# Altium schematic sheet Komunikacja.SchDoc: Low speed communications
size A3; SheetNumber: 7; SheetTotal: 17
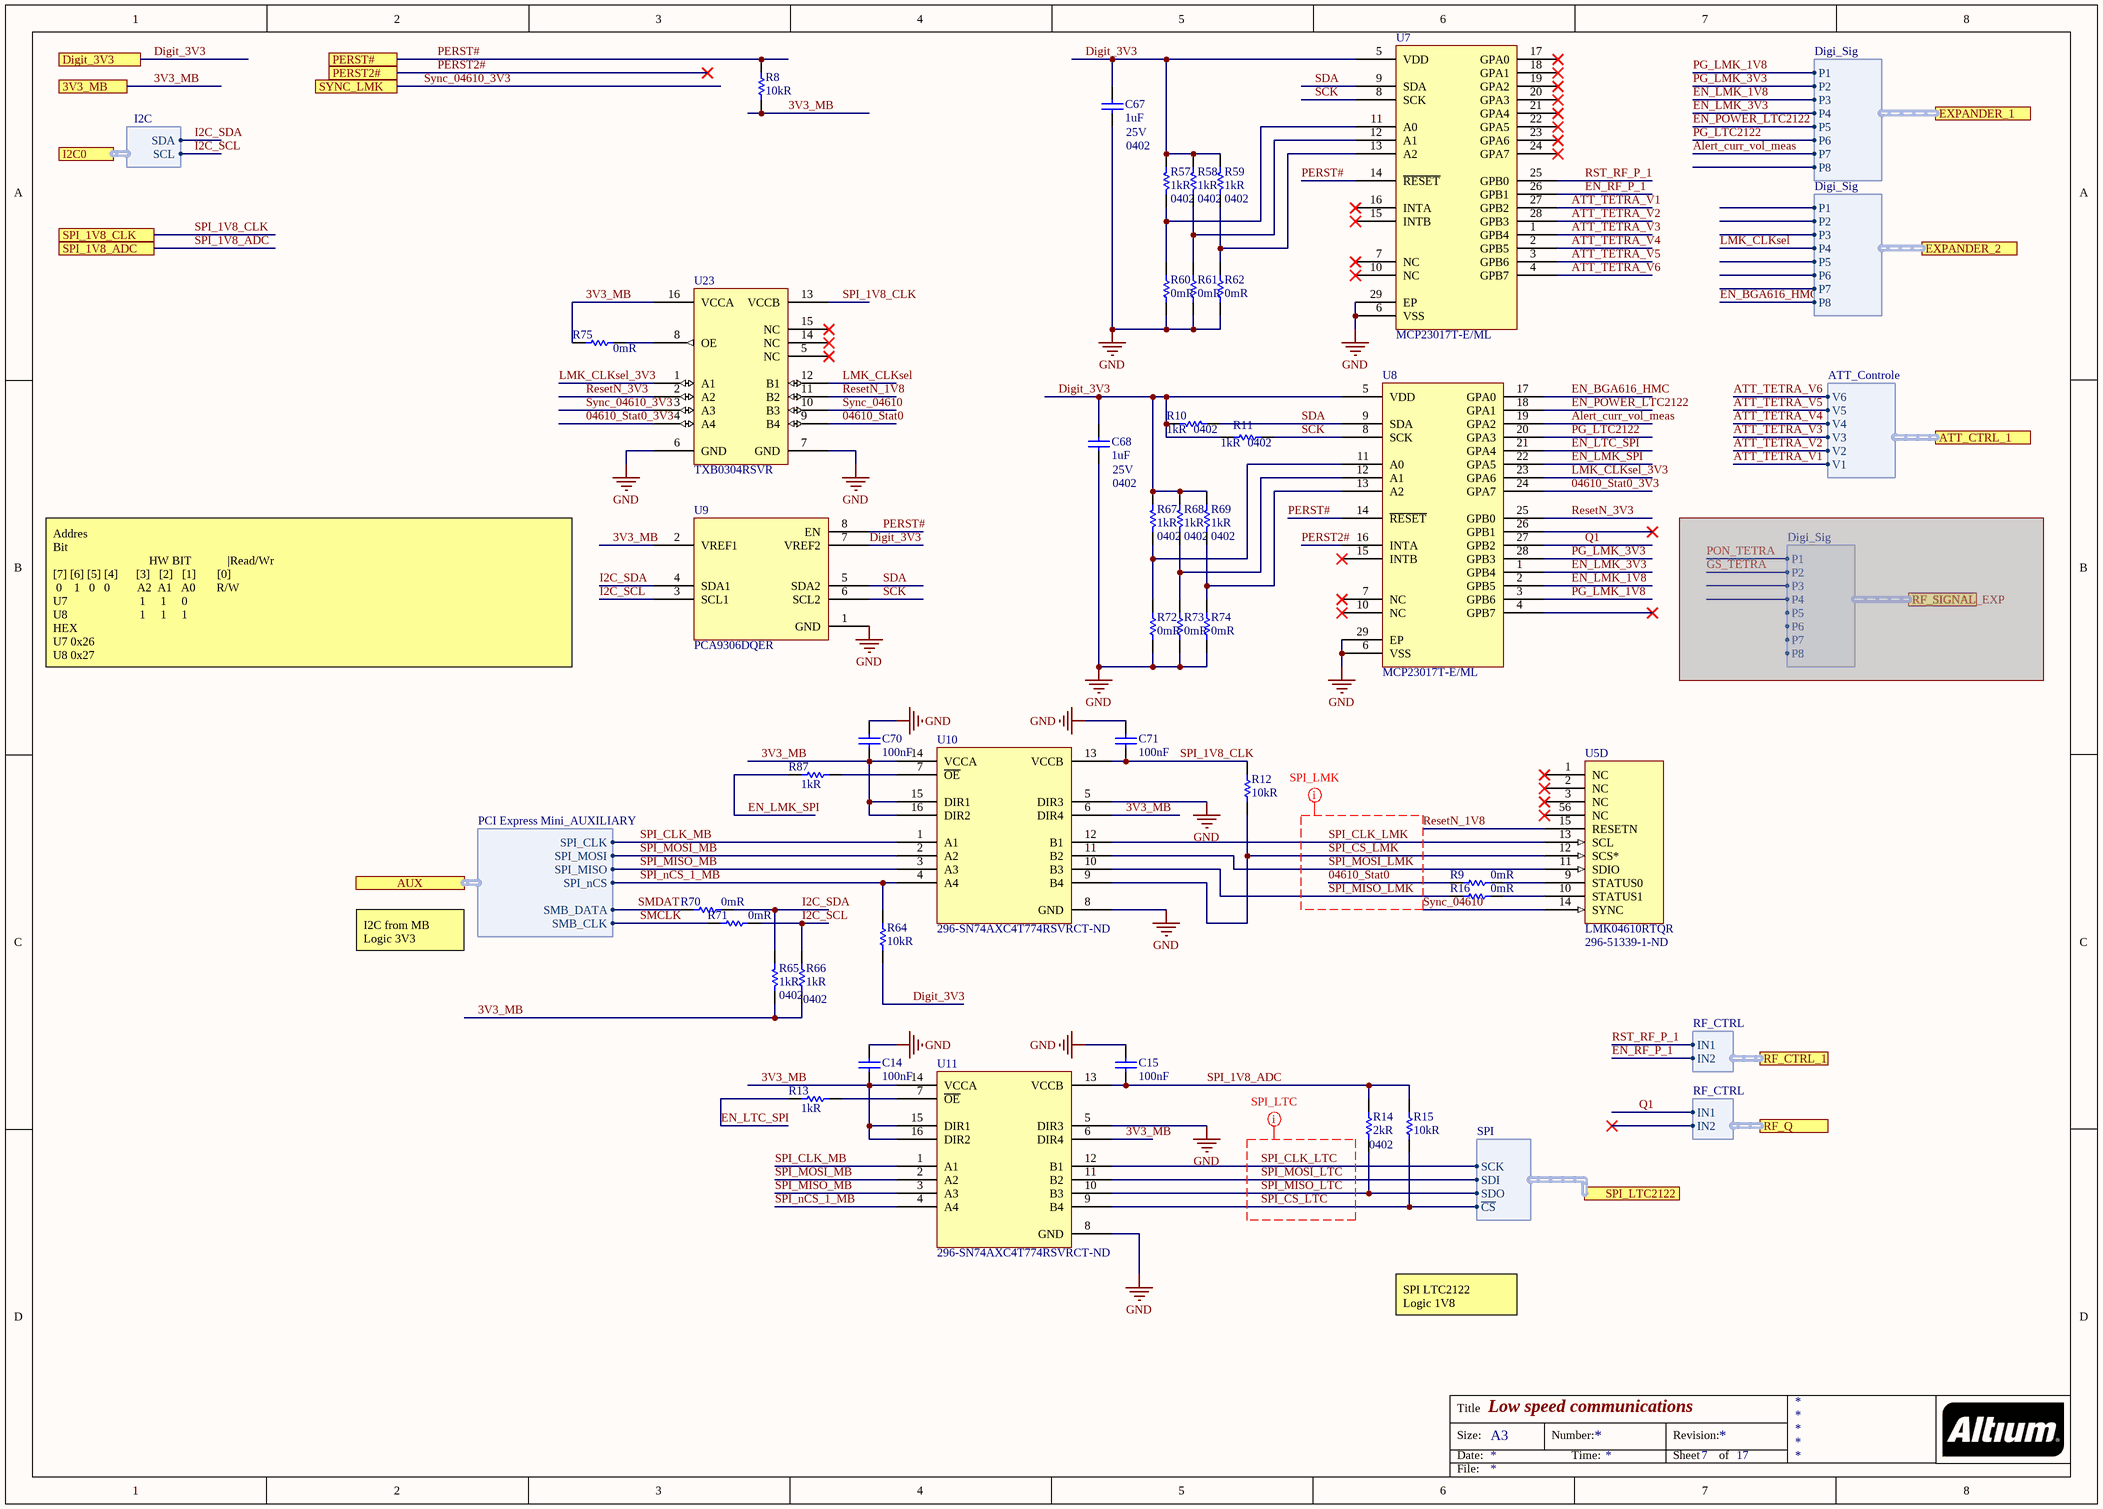
[diagram p0: Komunikacja.SchDoc]

## Parts
C14  100nF  [CAP 0201/0603 KK]
C15  100nF  [CAP 0201/0603 KK]
C67  1uF  Case/Package: 0402  Voltage Rating: 25V  [CAP 0402/1005 RF KK]
C68  1uF  Case/Package: 0402  Voltage Rating: 25V  [CAP 0402/1005 RF KK]
C70  100nF  [CAP 0201/0603 KK]
C71  100nF  [CAP 0201/0603 KK]
R8  10kR  [RES 0402/1005 RF KK]
R9  0mR  [RES 0402/1005 RF KK]
R10  1kR  Case/Package: 0402  [RES 0402/1005 RF KK]
R11  1kR  Case/Package: 0402  [RES 0402/1005 RF KK]
R12  10kR  [RES 0402/1005 RF KK]
R13  1kR  [RES 0402/1005 RF KK]
R14  2kR  Case/Package: 0402  [RES 0402/1005 RF KK]
R15  10kR  [RES 0402/1005 RF KK]
R16  0mR  [RES 0402/1005 RF KK]
R57  1kR  Case/Package: 0402  [RES 0402/1005 RF KK]
R58  1kR  Case/Package: 0402  [RES 0402/1005 RF KK]
R59  1kR  Case/Package: 0402  [RES 0402/1005 RF KK]
R60  0mR  [RES 0402/1005 RF KK]
R61  0mR  [RES 0402/1005 RF KK]
R62  0mR  [RES 0402/1005 RF KK]
R64  10kR  [RES 0402/1005 RF KK]
R65  1kR  Case/Package: 0402  [RES 0402/1005 RF KK]
R66  1kR  Case/Package: 0402  [RES 0402/1005 RF KK]
R67  1kR  Case/Package: 0402  [RES 0402/1005 RF KK]
R68  1kR  Case/Package: 0402  [RES 0402/1005 RF KK]
R69  1kR  Case/Package: 0402  [RES 0402/1005 RF KK]
R70  0mR  [RES 0402/1005 RF KK]
R71  0mR  [RES 0402/1005 RF KK]
R72  0mR  [RES 0402/1005 RF KK]
R73  0mR  [RES 0402/1005 RF KK]
R74  0mR  [RES 0402/1005 RF KK]
R75  0mR  [RES 0402/1005 RF KK]
R87  1kR  [RES 0402/1005 RF KK]
U5  LMK04610RTQR  Supplier Part Number 1: 296-51339-1-ND  [LMK04610]  (part D of 4)
U7  MCP23017T-E/ML  [MCP23017/MCP23S17]
U8  MCP23017T-E/ML  [MCP23017/MCP23S17]
U9  PCA9306DQER  [PCA9306]
U10  Supplier Part Number 1: 296-SN74AXC4T774RSVRCT-ND  [16-UGFN]  (hidden comment: SN74AXC4T774RSVR)
U11  Supplier Part Number 1: 296-SN74AXC4T774RSVRCT-ND  [16-UGFN]  (hidden comment: SN74AXC4T774RSVR)
U23  TXB0304RSVR  [TXB0304]

## Ports
3V3_MB, ATT_CTRL_1 (harness ATT_Controle), AUX (harness PCI Express Mini_AUXILIARY), Digit_3V3, EXPANDER_1 (harness Digi_Sig), EXPANDER_2 (harness Digi_Sig), I2C0 (harness I2C), PERST2#, PERST#, RF_CTRL_1 (harness RF_CTRL), RF_Q (harness RF_CTRL), RF_SIGNAL_EXP (harness Digi_Sig), SPI_1V8_ADC, SPI_1V8_CLK, SPI_LTC2122 (harness SPI), SYNC_LMK

## Harnesses
PCI Express Mini_AUXILIARY: SMB_DATA, SMB_CLK, SPI_nCS, SPI_MISO, SPI_MOSI, SPI_CLK
I2C: SDA, SCL
Digi_Sig: P1, P2, P3, P4, P5, P6, P7, P8
ATT_Controle: V1, V2, V3, V4, V5, V6
SPI: SCK, ~{CS}, SDO, SDI
RF_CTRL: IN1, IN2

## Nets
GND: C14.2 C15.2 C67.1 C68.1 C70.2 C71.2 R60.1 R61.1 R62.1 R72.1 R73.1 R74.1 U7.6(VSS) U7.29(EP) U8.6(VSS) U8.29(EP) U9.1(GND) U10.5(DIR3) U10.8(GND) U11.5(DIR3) U11.8(GND) U23.6(GND) U23.7(GND)
3V3_MB: C14.1 C70.1 R8.1 R65.2 R66.2 R75.1 U9.2(VREF1) U10.6(DIR4) U10.14(VCCA) U10.15(DIR1) U10.16(DIR2) U11.6(DIR4) U11.14(VCCA) U11.15(DIR1) U11.16(DIR2) U23.16(VCCA) ; port 3V3_MB
04610_Stat0: R9.2 U23.9(B4)
04610_Stat0_3V3: U8.24(GPA7) U23.4(A4)
Alert_curr_vol_meas: U8.19(GPA2) ; port EXPANDER_1.P7
ATT_TETRA_V1: U7.27(GPB2) ; port ATT_CTRL_1.V1
ATT_TETRA_V2: U7.28(GPB3) ; port ATT_CTRL_1.V2
ATT_TETRA_V3: U7.1(GPB4) ; port ATT_CTRL_1.V3
ATT_TETRA_V4: U7.2(GPB5) ; port ATT_CTRL_1.V4
ATT_TETRA_V5: U7.3(GPB6) ; port ATT_CTRL_1.V5
ATT_TETRA_V6: U7.4(GPB7) ; port ATT_CTRL_1.V6
Digit_3V3: C67.2 C68.2 R10.1 R11.1 R57.1 R58.1 R59.1 R64.1 R67.1 R68.1 R69.1 U7.5(VDD) U8.5(VDD) U9.7(VREF2) ; port Digit_3V3
EN_BGA616_HMC: U8.17(GPA0) ; port EXPANDER_2.P8
EN_LMK_1V8: U8.2(GPB5) ; port EXPANDER_1.P3
EN_LMK_3V3: U8.1(GPB4) ; port EXPANDER_1.P4
EN_LMK_SPI: R87.2 U8.22(GPA5)
EN_LTC_SPI: R13.2 U8.21(GPA4)
EN_POWER_LTC2122: U8.18(GPA1) ; port EXPANDER_1.P5
EN_RF_P_1: U7.26(GPB1) ; port RF_CTRL_1.IN2
I2C_SCL: R66.1 R71.2 U9.3(SCL1) ; port I2C0.SCL
I2C_SDA: R65.1 R70.2 U9.4(SDA1) ; port I2C0.SDA
LMK_CLKsel: U23.12(B1) ; port EXPANDER_2.P4
LMK_CLKsel_3V3: U8.23(GPA6) U23.1(A1)
PERST2#: U8.16(INTA) ; port PERST2#
PERST#: R8.2 U7.14(~{RESET}) U8.14(~{RESET}) U9.8(EN) ; port PERST#
PG_LMK_1V8: U8.3(GPB6) ; port EXPANDER_1.P1
PG_LMK_3V3: U8.28(GPB3) ; port EXPANDER_1.P2
PG_LTC2122: U8.20(GPA3) ; port EXPANDER_1.P6
Q1: U8.27(GPB2) ; port RF_Q.IN1
ResetN_1V8: U5.15(RESETN) U23.11(B2)
ResetN_3V3: U8.25(GPB0) U23.2(A2)
RST_RF_P_1: U7.25(GPB0) ; port RF_CTRL_1.IN1
SCK: R11.2 U7.8(SCK) U8.8(SCK) U9.6(SCL2)
SDA: R10.2 U7.9(SDA) U8.9(SDA) U9.5(SDA2)
SMCLK: R71.1 ; port AUX.SMB_CLK
SMDAT: R70.1 ; port AUX.SMB_DATA
SPI_1V8_ADC: C15.1 R14.2 R15.2 U11.13(VCCB) ; port SPI_1V8_ADC
SPI_1V8_CLK: C71.1 R12.2 U10.13(VCCB) U23.13(VCCB) ; port SPI_1V8_CLK
SPI_CLK_LMK: U5.13(SCL) U10.12(B1)
SPI_CLK_LTC: U11.12(B1) ; port SPI_LTC2122.SCK
SPI_CLK_MB: U10.1(A1) U11.1(A1) ; port AUX.SPI_CLK
SPI_CS_LMK: R12.1 U5.12(SCS*) U10.9(B4)
SPI_CS_LTC: R15.1 U11.9(B4) ; port SPI_LTC2122.~{CS}
SPI_MISO_LMK: R16.2 U10.10(B3)
SPI_MISO_LTC: R14.1 U11.10(B3) ; port SPI_LTC2122.SDO
SPI_MISO_MB: U10.3(A3) U11.3(A3) ; port AUX.SPI_MISO
SPI_MOSI_LMK: U5.11(SDIO) U10.11(B2)
SPI_MOSI_LTC: U11.11(B2) ; port SPI_LTC2122.SDI
SPI_MOSI_MB: U10.2(A2) U11.2(A2) ; port AUX.SPI_MOSI
SPI_nCS_1_MB: R64.2 U10.4(A4) U11.4(A4) ; port AUX.SPI_nCS
Sync_04610: U5.14(SYNC) U23.10(B3)
Sync_04610_3V3: U23.3(A3) ; port SYNC_LMK
NetR9_1: R9.1 U5.9(STATUS0)
NetR13_1: R13.1 U11.7(~{OE})
NetR16_1: R16.1 U5.10(STATUS1)
NetR57_2: R57.2 R60.2 U7.11(A0)
NetR58_2: R58.2 R61.2 U7.12(A1)
NetR59_2: R59.2 R62.2 U7.13(A2)
NetR67_2: R67.2 R72.2 U8.11(A0)
NetR68_2: R68.2 R73.2 U8.12(A1)
NetR69_2: R69.2 R74.2 U8.13(A2)
NetR75_2: R75.2 U23.8(OE)
NetR87_1: R87.1 U10.7(~{OE})

Not connected (* = marked no-connect by the designer): U5 1(NC)* 2(NC)* 3(NC)* 56(NC)*; U7 7(NC)* 10(NC)* 15(INTB)* 16(INTA)* 17(GPA0)* 18(GPA1)* 19(GPA2)* 20(GPA3)* 21(GPA4)* 22(GPA5)* 23(GPA6)* 24(GPA7)*; U8 4(GPB7)* 7(NC)* 10(NC)* 15(INTB)* 26(GPB1)*; U23 5(NC)* 14(NC)* 15(NC)*

## Layout directives
net class SPI_LMK: 04610_Stat0, ResetN_1V8, SPI_CLK_LMK, SPI_CS_LMK, SPI_MISO_LMK, SPI_MOSI_LMK, Sync_04610
net class SPI_LTC: SPI_CLK_LTC, SPI_CS_LTC, SPI_MISO_LTC, SPI_MOSI_LTC

## Notes on the sheet
- Addres
  Bit
  HW BIT            |Read/Wr
  [7] [6] [5] [4]      [3]   [2]   [1]       [0]
  0    1   0   0         A2  A1   A0       R/W
  U7                        1     1     0
  U8                        1     1     1
  HEX
  U7 0x26
  U8 0x27
- I2C from MB
  Logic 3V3
- SPI LTC2122
  Logic 1V8
- Title
- Size:
- Date:
- A3
- Number:
- Time:
- Revision:
- Sheet
- of
- File:

## Library data of the parts
C14 C15 C70 C71 = Capacitor: Manufacturer 1: Murata; Manufacturer Part Number 1: GRM033R61C104ME84D; Voltage Rating: 16V; Tolerance: 20%; Dielectric: X5R; Supplier 1: Digi-Key; Supplier Part Number 1: 490-9986-1-ND; Stock 1: 503570; Pricing 1: 1=0.10000, 10=0.05400, 100=0.02430, 500=0.01732, 1000=0.01361, 2500=0.01238, 5000=0.01139 (USD); RoHS: Yes; Mount: Surface Mount; Case/Package: 0201; Weight: 1.2E-05oz; Case Code (Metric): 0603; Case Code (Imperial): 0201; Min Operating Temperature: -55°C; Max Operating Temperature: 85°C; Capacitance: 100nF; Packaging: Tape and Reel; Termination: SMD/SMT; Voltage Rating (DC): 16V; Package Quantity: 15000; Length: 0.024inch; Height: 0.3mm; Width: 0.3mm; Thickness: 0.013inch; ComponentLink1URL: http://www.mouser.com/ds/2/281/c02e-2905.pdf?src-supplier=Mouser; ComponentLink1Description: http://www.mouser.com/ds/2/281/c02e-2905.pdf?src-supplier=Mouser; ComponentLink2URL: http://search.murata.co.jp/Ceramy/image/img/A01X/G101/ENG/GRM033R61C104ME84-01.pdf?src-supplier=Digi-Key; ComponentLink2Description: http://search.murata.co.jp/Ceramy/image/img/A01X/G101/ENG/GRM033R61C104ME84-01.pdf?src-supplier=Digi-Key
C67 C68 = Capacitor: MURATA - GRT155R61E105KE01D - SMD Multilayer Ceramic Capacitor, 1 µF, 25 V, 0402 [1005 Metric], ± 10%, X5R, GRT Series - SMD Multilayer Ceramic Capacitor, 1 µF, 25 V, 0402 [1005 Metric], ± 10%, X5R, GRT Series; Supplier 1: Digi-Key; Supplier Part Number 1: 490-12263-1-ND; Manufacturer: Murata; Manufacturer Part Number: GRT155R61E105KE01D; RoHS: Yes; Category: Ceramic Capacitors; Stock 1: 341453; Pricing 1: 1=0,18000, 10=0,12300, 100=0,06210, 500=0,04248, 1000=0,03758, 2500=0,03594, 5000=0,03268 (USD); Mount: Surface Mount; Case Code (Metric): 1005; Case Code (Imperial): 0402; Min Operating Temperature: -55°C; Max Operating Temperature: 85°C; Packaging: Tape and Reel; Capacitance: 1uF; Tolerance: 10%; Dielectric: X5R; Voltage Rating (DC): 25V; Length: 0.039inch; Width: 0.02inch; Thickness: 0.022inch; Ratings: AEC-Q200; ComponentLink1URL: http://www.farnell.com/datasheets/2165918.pdf?src-supplier=Farnell; ComponentLink1Description: http://www.farnell.com/datasheets/2165918.pdf?src-supplier=Farnell; ComponentLink2URL: http://search.murata.co.jp/Ceramy/image/img/A01X/G101/ENG/GRT155R61E105KE01-01.pdf?src-supplier=Digi-Key; ComponentLink2Description: http://search.murata.co.jp/Ceramy/image/img/A01X/G101/ENG/GRT155R61E105KE01-01.pdf?src-supplier=Digi-Key; ComponentLink3URL: http://www.farnell.com/datasheets/2165918.pdf?src-supplier=Element14; ComponentLink3Description: http://www.farnell.com/datasheets/2165918.pdf?src-supplier=Element14
R8 R12 R15 R64 = Resistor: Manufacturer 1: Vishay; Manufacturer Part Number 1: CRCW0402-10K0FKED; Tolerance: 1%; Power Rating: 63mW; Voltage Rating: 50V; Temperature Coefficient: 100ppm/°C; Supplier 1: Newark; Supplier Part Number 1: 52K6595; Stock 1: 0; RoHS: Yes; Mount: Surface Mount; Case/Package: 0402; Number of Pins: 2; Weight: 2.3E-05oz; Case Code (Metric): 1005; Case Code (Imperial): 0402; Contact Plating: Tin; Min Operating Temperature: -55°C; Max Operating Temperature: 155°C; Resistance: 10kR; Package Quantity: 10; Packaging: Tape and Reel; Termination: SMD/SMT; Military Standard: Not; Composition: Thick Film; Voltage Rating (DC): 50V; Number of Terminations: 2; Max Power Dissipation: 63mW; Features: Automotive AEC-Q200; Length: 1mm; Height: 0.35mm; Depth: 0.5mm; Width: 0.02inch; Radiation Hardening: No; REACH SVHC: Unknown; Lead Free: Lead Free; ComponentLink1URL: https://datasheet.ciiva.com/11809/0900766b80d98824-11809984.pdf?src-supplier=RSComponents; ComponentLink1Description: https://datasheet.ciiva.com/11809/0900766b80d98824-11809984.pdf?src-supplier=RSComponents; ComponentLink2URL: https://datasheet.ciiva.com/2463/dcrcwe3-2463025.pdf?src-supplier=Digi-Key; ComponentLink2Description: https://datasheet.ciiva.com/2463/dcrcwe3-2463025.pdf?src-supplier=Digi-Key; ComponentLink3URL: https://datasheet.ciiva.com/2463/dcrcwe3-2463026.pdf?src-supplier=Digi-Key; ComponentLink3Description: https://datasheet.ciiva.com/2463/dcrcwe3-2463026.pdf?src-supplier=Digi-Key; ComponentLink4URL: https://datasheet.ciiva.com/2463/dcrcwe3-2463027.pdf?src-supplier=Digi-Key; ComponentLink4Description: https://datasheet.ciiva.com/2463/dcrcwe3-2463027.pdf?src-supplier=Digi-Key; ComponentLink5URL: https://datasheet.ciiva.com/46385/1697337-46385560.pdf?src-supplier=Element14; ComponentLink5Description: https://datasheet.ciiva.com/46385/1697337-46385560.pdf?src-supplier=Element14; ComponentLink6URL: https://datasheet.ciiva.com/3255/dcrcwe3-3255961.pdf?src-supplier=Avnet; ComponentLink6Description: https://datasheet.ciiva.com/3255/dcrcwe3-3255961.pdf?src-supplier=Avnet; ComponentLink7URL: https://datasheet.ciiva.com/3255/dcrcwe3-3255962.pdf?src-supplier=Avnet; ComponentLink7Description: https://datasheet.ciiva.com/3255/dcrcwe3-3255962.pdf?src-supplier=Avnet; ComponentLink8URL: https://datasheet.ciiva.com/5547/dcrcwe3-109170-5547786.pdf?src-supplier=Mouser; ComponentLink8Description: https://datasheet.ciiva.com/5547/dcrcwe3-109170-5547786.pdf?src-supplier=Mouser; ComponentLink9URL: https://datasheet.ciiva.com/26316/fld-crcw-e3-data-en-26316618.pdf?src-supplier=Distrelec; ComponentLink9Description: https://datasheet.ciiva.com/26316/fld-crcw-e3-data-en-26316618.pdf?src-supplier=Distrelec; ComponentLink10URL: https://datasheet.ciiva.com/16208/dcrcwe3-16208525.pdf?src-supplier=Future+Electronics; ComponentLink10Description: https://datasheet.ciiva.com/16208/dcrcwe3-16208525.pdf?src-supplier=Future+Electronics; ComponentLink11URL: https://datasheet.ciiva.com/36856/1720486-36856909.pdf?src-supplier=Element14; ComponentLink11Description: https://datasheet.ciiva.com/36856/1720486-36856909.pdf?src-supplier=Element14
R9 R16 R60 R70 R71 R75 = Resistor: YAGEO - RC0402JR-070RL. - RES, THICK FILM, 0R, 0.0625W, 0402; Power Rating: 62.5mW; Tolerance: 5%; Voltage Rating: 50V; Max Power Dissipation: 63mW; Temperature Coefficient: 200ppm/°C; Supplier 1: Digi-Key; Supplier Part Number 1: 311-0.0JRCT-ND; Manufacturer: Yageo; Manufacturer Part Number: RC0402JR-070RL; RoHS: Yes; Category: Chip SMD Resistors; Stock 1: 45338179; Pricing 1: 1=0,10000, 10=0,01200, 25=0,00920, 50=0,00680, 100=0,00510, 250=0,00388, 500=0,00310, 1000=0,00228, 5000=0,00163 (USD); Case/Package: 0402; Case Code (Metric): 1005; Case Code (Imperial): 0402; Contact Plating: Tin,Matte; Min Operating Temperature: -55°C; Max Operating Temperature: 155°C; Package Quantity: 1; Resistance: 0mR; Packaging: Tape and Reel; Resistor Type: Thick Film; Number of Terminations: 2; Termination: SMD/SMT; Features: Moisture Resistant; Length: 1mm; Height: 0.016inch; Width: 0.02inch; Depth: 0.5mm; Radiation Hardening: No; REACH SVHC: Unknown; Military Standard: Not; Lead Free: Lead Free; ComponentLink1URL: https://datasheet.ciiva.com/2452/pyu-rc0402-51-rohs-l-6-2452608.pdf?src-supplier=Digi-Key; ComponentLink1Description: https://datasheet.ciiva.com/2452/pyu-rc0402-51-rohs-l-6-2452608.pdf?src-supplier=Digi-Key; ComponentLink2URL: https://datasheet.ciiva.com/11808/0900766b80c66297-11808195.pdf?src-supplier=RSComponents; ComponentLink2Description: https://datasheet.ciiva.com/11808/0900766b80c66297-11808195.pdf?src-supplier=RSComponents; ComponentLink3URL: https://datasheet.ciiva.com/2452/pyu-r-int-thick-7-2452609.pdf?src-supplier=Digi-Key; ComponentLink3Description: https://datasheet.ciiva.com/2452/pyu-r-int-thick-7-2452609.pdf?src-supplier=Digi-Key; ComponentLink4URL: https://datasheet.ciiva.com/2452/pyu-r-int-thick-7-2452610.pdf?src-supplier=Digi-Key; ComponentLink4Description: https://datasheet.ciiva.com/2452/pyu-r-int-thick-7-2452610.pdf?src-supplier=Digi-Key; ComponentLink5URL: https://datasheet.ciiva.com/8896/pyu-rc0402-51-rohs-l-6-8896201.pdf?src-supplier=Avnet; ComponentLink5Description: https://datasheet.ciiva.com/8896/pyu-rc0402-51-rohs-l-6-8896201.pdf?src-supplier=Avnet; ComponentLink6URL: https://datasheet.ciiva.com/28386/pyu-rc0402-51-rohs-l-6-28386633.pdf?src-supplier=Avnet+Europe; ComponentLink6Description: https://datasheet.ciiva.com/28386/pyu-rc0402-51-rohs-l-6-28386633.pdf?src-supplier=Avnet+Europe; ComponentLink7URL: https://datasheet.ciiva.com/22747/1018594-22747515.pdf?src-supplier=Element14; ComponentLink7Description: https://datasheet.ciiva.com/22747/1018594-22747515.pdf?src-supplier=Element14; ComponentLink8URL: https://datasheet.ciiva.com/15189/getdatasheetpartid-326379-15189533.pdf?src-supplier=Verical; ComponentLink8Description: https://datasheet.ciiva.com/15189/getdatasheetpartid-326379-15189533.pdf?src-supplier=Verical
R10 R11 R13 R57-R59 R65-R69 R87 = Resistor: Manufacturer 1: Yageo; Manufacturer Part Number 1: RC0402FR-071KL; Tolerance: 1%; Temperature Coefficient: 100ppm/°C; Power Rating: 62.5mW; Voltage Rating: 50V; Supplier 1: Digi-Key; Supplier Part Number 1: 311-1.00KLRCT-ND; Stock 1: 57541929; Pricing 1: 1=0,10000, 10=0,01600, 100=0,00640, 1000=0,00289, 2500=0,00251, 5000=0,00207 (USD); RoHS: Yes; Number of Pins: 2; Case Code (Imperial): 0402; Case Code (Metric): 1005; Min Operating Temperature: -55°C; Max Operating Temperature: 155°C; Packaging: Tape and Reel; Resistance: 1kR; Composition: Thick Film; Voltage Rating (DC): 50V; Termination: SMD/SMT; Military Standard: Not; Length: 1mm; Height: 0.32mm; Width: 0.5mm; Depth: 0.5mm; REACH SVHC: Unknown; Lead Free: Lead Free; ComponentLink1URL: https://datasheet.ciiva.com/11819/0900766b80c66297-11819477.pdf?src-supplier=RSComponents; ComponentLink1Description: https://datasheet.ciiva.com/11819/0900766b80c66297-11819477.pdf?src-supplier=RSComponents; ComponentLink2URL: https://datasheet.ciiva.com/12666/pyu-rc0402-51-rohs-l-6-r-12666741.pdf?src-supplier=Mouser; ComponentLink2Description: https://datasheet.ciiva.com/12666/pyu-rc0402-51-rohs-l-6-r-12666741.pdf?src-supplier=Mouser; ComponentLink3URL: https://datasheet.ciiva.com/17063/pyu-rc0402-51-rohs-l-6-r-17063193.pdf?src-supplier=Future+Electronics; ComponentLink3Description: https://datasheet.ciiva.com/17063/pyu-rc0402-51-rohs-l-6-r-17063193.pdf?src-supplier=Future+Electronics; ComponentLink4URL: https://datasheet.ciiva.com/22747/1018594-22747513.pdf?src-supplier=Element14; ComponentLink4Description: https://datasheet.ciiva.com/22747/1018594-22747513.pdf?src-supplier=Element14; ComponentLink5URL: https://datasheet.ciiva.com/7849/1018594-7849869.pdf?src-supplier=Element14; ComponentLink5Description: https://datasheet.ciiva.com/7849/1018594-7849869.pdf?src-supplier=Element14; ComponentLink6URL: https://datasheet.ciiva.com/7983/1018594-7983502.pdf?src-supplier=Element14; ComponentLink6Description: https://datasheet.ciiva.com/7983/1018594-7983502.pdf?src-supplier=Element14; ComponentLink7URL: https://datasheet.ciiva.com/7849/1018594-7849871.pdf?src-supplier=Element14; ComponentLink7Description: https://datasheet.ciiva.com/7849/1018594-7849871.pdf?src-supplier=Element14
  R13 R87: Case/Package: 0402
R14 = Resistor: YAGEO - RC0402FR-072KL - SMD Chip Resistor, 0402 [1005 Metric], 2 kohm, RC Series, 50 V, Thick Film, 63 mW; Tolerance: 1%; Power Rating: 63mW; Voltage Rating: 50V; Temperature Coefficient: 100ppm/°C; Supplier 1: Digi-Key; Supplier Part Number 1: 311-2KLRCT-ND; Manufacturer: Yageo; Manufacturer Part Number: RC0402FR-072KL; RoHS: Yes; Category: Chip SMD Resistors; Stock 1: 2031346; Pricing 1: 1=0,10000, 10=0,01500, 100=0,00620, 1000=0,00278, 2500=0,00242, 5000=0,00200 (USD); Case Code (Metric): 1005; Case Code (Imperial): 0402; Min Operating Temperature: -55°C; Max Operating Temperature: 155°C; Package Quantity: 1; Resistance: 2kR; Packaging: Tape and Reel; Composition: Thick Film; Number of Terminations: 2; Termination: SMD/SMT; Military Standard: Not; Max Power Dissipation: 63mW; Voltage Rating (DC): 50V; Working Voltage: 50V; Features: Moisture Resistant; Length: 1mm; Height: 0.016inch; Width: 0.02inch; Depth: 0.5mm; REACH SVHC: Unknown; Lead Free: Lead Free; ComponentLink1URL: https://datasheet.ciiva.com/11808/0900766b80c66297-11808787.pdf?src-supplier=RSComponents; ComponentLink1Description: https://datasheet.ciiva.com/11808/0900766b80c66297-11808787.pdf?src-supplier=RSComponents; ComponentLink2URL: https://datasheet.ciiva.com/2453/pyu-r-int-thick-7-2453634.pdf?src-supplier=Digi-Key; ComponentLink2Description: https://datasheet.ciiva.com/2453/pyu-r-int-thick-7-2453634.pdf?src-supplier=Digi-Key; ComponentLink3URL: https://datasheet.ciiva.com/2453/pyu-r-int-thick-7-2453635.pdf?src-supplier=Digi-Key; ComponentLink3Description: https://datasheet.ciiva.com/2453/pyu-r-int-thick-7-2453635.pdf?src-supplier=Digi-Key; ComponentLink4URL: https://datasheet.ciiva.com/2453/pyu-r-int-thick-7-2453636.pdf?src-supplier=Digi-Key; ComponentLink4Description: https://datasheet.ciiva.com/2453/pyu-r-int-thick-7-2453636.pdf?src-supplier=Digi-Key; ComponentLink5URL: https://datasheet.ciiva.com/15189/getdatasheetpartid-358921-15189414.pdf?src-supplier=Verical; ComponentLink5Description: https://datasheet.ciiva.com/15189/getdatasheetpartid-358921-15189414.pdf?src-supplier=Verical; ComponentLink6URL: https://datasheet.ciiva.com/12667/pyu-rc0402-51-rohs-l-6-r-12667451.pdf?src-supplier=Mouser; ComponentLink6Description: https://datasheet.ciiva.com/12667/pyu-rc0402-51-rohs-l-6-r-12667451.pdf?src-supplier=Mouser; ComponentLink7URL: https://datasheet.ciiva.com/7983/1018594-7983517.pdf?src-supplier=Element14; ComponentLink7Description: https://datasheet.ciiva.com/7983/1018594-7983517.pdf?src-supplier=Element14; ComponentLink8URL: https://datasheet.ciiva.com/7849/1018594-7849934.pdf?src-supplier=Element14; ComponentLink8Description: https://datasheet.ciiva.com/7849/1018594-7849934.pdf?src-supplier=Element14; ComponentLink9URL: https://datasheet.ciiva.com/7849/1018594-7849935.pdf?src-supplier=Element14; ComponentLink9Description: https://datasheet.ciiva.com/7849/1018594-7849935.pdf?src-supplier=Element14
R61 R62 R72-R74 = Resistor: Manufacturer 1: Yageo; Manufacturer Part Number 1: RC0402JR-070RL; Power Rating: 62.5mW; Tolerance: 5%; Voltage Rating: 50V; Max Power Dissipation: 63mW; Temperature Coefficient: 200ppm/°C; Supplier 1: Digi-Key; Supplier Part Number 1: 311-0.0JRCT-ND; Stock 1: 69822252; Pricing 1: 1=0.10000, 10=0.01200, 25=0.00920, 50=0.00680, 100=0.00510, 250=0.00388, 500=0.00308, 1000=0.00227, 5000=0.00163 (USD); RoHS: Yes; Case/Package: 0402; Contact Plating: Tin,Matte; Case Code (Metric): 1005; Case Code (Imperial): 0402; Min Operating Temperature: -55°C; Max Operating Temperature: 155°C; Resistance: 0mR; Packaging: Tape and Reel; Composition: Thick Film; Package Quantity: 1; Number of Terminations: 2; Termination: SMD/SMT; Military Standard: Not; Features: Moisture Resistant; Length: 1mm; Height: 0.016inch; Width: 0.02inch; Depth: 0.5mm; Radiation Hardening: No; REACH SVHC: Unknown; Lead Free: Lead Free; ComponentLink1URL: https://datasheet.ciiva.com/2452/pyu-rc0402-51-rohs-l-6-2452608.pdf?src-supplier=Digi-Key; ComponentLink1Description: https://datasheet.ciiva.com/2452/pyu-rc0402-51-rohs-l-6-2452608.pdf?src-supplier=Digi-Key; ComponentLink2URL: https://datasheet.ciiva.com/11808/0900766b80c66297-11808195.pdf?src-supplier=RSComponents; ComponentLink2Description: https://datasheet.ciiva.com/11808/0900766b80c66297-11808195.pdf?src-supplier=RSComponents; ComponentLink3URL: https://datasheet.ciiva.com/2452/pyu-r-int-thick-7-2452609.pdf?src-supplier=Digi-Key; ComponentLink3Description: https://datasheet.ciiva.com/2452/pyu-r-int-thick-7-2452609.pdf?src-supplier=Digi-Key; ComponentLink4URL: https://datasheet.ciiva.com/22747/1018594-22747515.pdf?src-supplier=Element14; ComponentLink4Description: https://datasheet.ciiva.com/22747/1018594-22747515.pdf?src-supplier=Element14; ComponentLink5URL: https://datasheet.ciiva.com/7983/1018594-7983535.pdf?src-supplier=Element14; ComponentLink5Description: https://datasheet.ciiva.com/7983/1018594-7983535.pdf?src-supplier=Element14; ComponentLink6URL: https://datasheet.ciiva.com/2452/pyu-r-int-thick-7-2452610.pdf?src-supplier=Digi-Key; ComponentLink6Description: https://datasheet.ciiva.com/2452/pyu-r-int-thick-7-2452610.pdf?src-supplier=Digi-Key; ComponentLink7URL: https://datasheet.ciiva.com/8896/pyu-rc0402-51-rohs-l-6-8896201.pdf?src-supplier=Avnet; ComponentLink7Description: https://datasheet.ciiva.com/8896/pyu-rc0402-51-rohs-l-6-8896201.pdf?src-supplier=Avnet; ComponentLink8URL: https://datasheet.ciiva.com/28386/pyu-rc0402-51-rohs-l-6-28386633.pdf?src-supplier=Avnet+Europe; ComponentLink8Description: https://datasheet.ciiva.com/28386/pyu-rc0402-51-rohs-l-6-28386633.pdf?src-supplier=Avnet+Europe; ComponentLink9URL: https://datasheet.ciiva.com/15189/getdatasheetpartid-326379-15189533.pdf?src-supplier=Verical; ComponentLink9Description: https://datasheet.ciiva.com/15189/getdatasheetpartid-326379-15189533.pdf?src-supplier=Verical
U5 = LMK04610RTQR: Manufacturer: Texas Instruments; Number of Inputs: 2; Number of Outputs: 10; Supplier 1: Digi-Key; Manufacturer Part Number: LMK04610RTQR; Stock 1: 2022; Pricing 1: 1 = 20,47000, 10 = 18,87700, 100 = 16,11940, 500 = 14,63474 (USD); RoHS: No; Min Operating Temperature: -40°C; Max Operating Temperature: 85°C
U7 U8 = MCP23017T-E/ML: IC I/O EXPANDER I2C 16B 28QFN; Manufacturer: Microchip; Output Current: 25mA; Interface: I2C,Serial; Operating Supply Voltage: 5.5V; Number of I/Os: 16; Power Dissipation: 700mW; Max Frequency: 1.7MHz; Supplier 1: Digi-Key; Manufacturer Part Number: MCP23017T-E/ML; Stock 1: 7016; Pricing 1: 1 = 1,45000, 25 = 1,21560, 100 = 1,10210 (USD); RoHS: Yes; Case/Package: QFN; Contact Plating: Tin,Matte; Min Operating Temperature: -40°C; Max Operating Temperature: 125°C; Package Quantity: 1600; Packaging: Tape and Reel; Frequency: 1.7MHz; Number of Bits: 16; Lead Free: Lead Free; ComponentLink1URL: https://datasheet.ciiva.com/1780/21952b-1780757.pdf?src-supplier=Digi-Key; ComponentLink1Description: https://datasheet.ciiva.com/1780/21952b-1780757.pdf?src-supplier=Digi-Key; ComponentLink2URL: https://datasheet.ciiva.com/16454/filehandler-aspxddocname-en023709-16454263.pdf?src-supplier=Future+Electronics; ComponentLink2Description: https://datasheet.ciiva.com/16454/filehandler-aspxddocname-en023709-16454263.pdf?src-supplier=Future+Electronics; ComponentLink3URL: https://datasheet.ciiva.com/8128/21952b-8128584.pdf?src-supplier=Avnet; ComponentLink3Description: https://datasheet.ciiva.com/8128/21952b-8128584.pdf?src-supplier=Avnet; Supplier Part Number 1: MCP23017T-E/MLCT-ND
U9 = PCA9306DQER: TEXAS INSTRUMENTS   PCA9306DQER.   IC, SMBus, 5V, X2SON-8; Number of Channels: 2; Propagation Delay: 0.3ns; Min Supply Voltage: 0uV; Logic Function: Translator; Turn-On Delay Time: 1.4ns; Low Level Output Current: 128mA; Output Type: I2C; Supplier 1: Digi-Key; Manufacturer 1: Texas Instruments; Manufacturer Part Number 1: PCA9306DQER; Stock 1: 25002; Pricing 1: 1=0,67000, 10=0,59100, 100=0,45340, 500=0,35844, 1000=0,28675 (USD); RoHS: Yes; Number of Pins: 8; Min Operating Temperature: -40°C; Max Operating Temperature: 85°C; Max Supply Voltage: 5V; Package Quantity: 1; Number of Outputs: 2; Number of Bits: 2; Packaging: Tape and Reel; Length: 1.45mm; Height: 0.35mm; Width: 1.05mm; Radiation Hardening: No; REACH SVHC: No SVHC; Lead Free: Lead Free; ComponentLink1URL: https://datasheet.ciiva.com/22631/1719693-22631024.pdf?src-supplier=Element14; ComponentLink1Description: https://datasheet.ciiva.com/22631/1719693-22631024.pdf?src-supplier=Element14; ComponentLink2URL: https://datasheet.ciiva.com/1899/pca9306-1899328.pdf?src-supplier=Digi-Key; ComponentLink2Description: https://datasheet.ciiva.com/1899/pca9306-1899328.pdf?src-supplier=Digi-Key; ComponentLink3URL: https://datasheet.ciiva.com/15095/getdatasheetpartid-306496-15095555.pdf?src-supplier=Verical; ComponentLink3Description: https://datasheet.ciiva.com/15095/getdatasheetpartid-306496-15095555.pdf?src-supplier=Verical; ComponentLink4URL: https://datasheet.ciiva.com/1504/1862428-1504149.pdf?src-supplier=Element14; ComponentLink4Description: https://datasheet.ciiva.com/1504/1862428-1504149.pdf?src-supplier=Element14; ComponentLink5URL: https://datasheet.ciiva.com/1899/pca9306-1899326.pdf?src-supplier=Digi-Key; ComponentLink5Description: https://datasheet.ciiva.com/1899/pca9306-1899326.pdf?src-supplier=Digi-Key; ComponentLink6URL: https://datasheet.ciiva.com/14287/pca9306-14287374.pdf?src-supplier=Avnet; ComponentLink6Description: https://datasheet.ciiva.com/14287/pca9306-14287374.pdf?src-supplier=Avnet; ComponentLink7URL: https://datasheet.ciiva.com/14287/pca9306-14287470.pdf?src-supplier=Avnet; ComponentLink7Description: https://datasheet.ciiva.com/14287/pca9306-14287470.pdf?src-supplier=Avnet; ComponentLink8URL: https://datasheet.ciiva.com/1899/pca9306-1899327.pdf?src-supplier=Digi-Key; ComponentLink8Description: https://datasheet.ciiva.com/1899/pca9306-1899327.pdf?src-supplier=Digi-Key; ComponentLink9URL: https://datasheet.ciiva.com/26041/pca9306-26041014.pdf?src-supplier=Avnet+Europe; ComponentLink9Description: https://datasheet.ciiva.com/26041/pca9306-26041014.pdf?src-supplier=Avnet+Europe; Supplier Part Number 1: 296-27957-1-ND
U10 U11 = SN74AXC4T774RSVR: 4-bit dual-supply bus transceiver with 3-state outputs and independent direction control inputs 16-UQFN -40 to 125; Manufacturer: Texas Instruments; Supplier 1: Digi-Key; Manufacturer Part Number: SN74AXC4T774RSVR; RoHS: No; Category: Buffers, Drivers and Transceivers; Stock 1: 2179; Pricing 1: 1=1,21000, 10=1,08600, 25=1,03040, 100=0,84640, 250=0,79120, 500=0,69920, 1000=0,55200 (USD)
U23 = TXB0304RSVR: IC TRNSLTR BIDIRECTIONAL 16UQFN; Manufacturer 1: Texas Instruments; Nominal Supply Current: 5uA; Max Supply Voltage: 3.6V; Min Supply Voltage: 900mV; Data Rate: 140Mbps; Number of Channels: 4; Propagation Delay: 4.8ns; Logic Function: Translator; Turn-On Delay Time: 18.9ns; High Level Output Current: -20uA; Low Level Output Current: 20uA; Quiescent Current: 10uA; Supplier 1: Digi-Key; Manufacturer Part Number 1: TXB0304RSVR; Stock 1: 1758; Pricing 1: 1=1.45000, 10=1.29700, 100=1.01160, 500=0.83564, 1000=0.65972 (USD); RoHS: Yes; Mount: Surface Mount; Number of Pins: 16; Contact Plating: Gold; Min Operating Temperature: -40°C; Max Operating Temperature: 85°C; Packaging: Tape and Reel; Package Quantity: 1; Number of Bits: 4; Number of Inputs: 4; Number of Outputs: 4; Radiation Hardening: No; REACH SVHC: No SVHC; Lead Free: Lead Free; ComponentLink1URL: https://datasheet.ciiva.com/1900/txb0304-1900817.pdf?src-supplier=Digi-Key; ComponentLink1Description: https://datasheet.ciiva.com/1900/txb0304-1900817.pdf?src-supplier=Digi-Key; ComponentLink2URL: https://datasheet.ciiva.com/15096/getdatasheetpartid-490462-15096317.pdf?src-supplier=Verical; ComponentLink2Description: https://datasheet.ciiva.com/15096/getdatasheetpartid-490462-15096317.pdf?src-supplier=Verical; ComponentLink3URL: https://datasheet.ciiva.com/1900/txb0304-1900818.pdf?src-supplier=Digi-Key; ComponentLink3Description: https://datasheet.ciiva.com/1900/txb0304-1900818.pdf?src-supplier=Digi-Key; ComponentLink4URL: https://datasheet.ciiva.com/1900/txb0304-1900819.pdf?src-supplier=Digi-Key; ComponentLink4Description: https://datasheet.ciiva.com/1900/txb0304-1900819.pdf?src-supplier=Digi-Key; ComponentLink5URL: https://datasheet.ciiva.com/14287/txb0304-14287243.pdf?src-supplier=Avnet; ComponentLink5Description: https://datasheet.ciiva.com/14287/txb0304-14287243.pdf?src-supplier=Avnet; Supplier Part Number 1: 296-29681-1-ND